# Altium project Main_Board.PrjPcb (part 43 of 44)
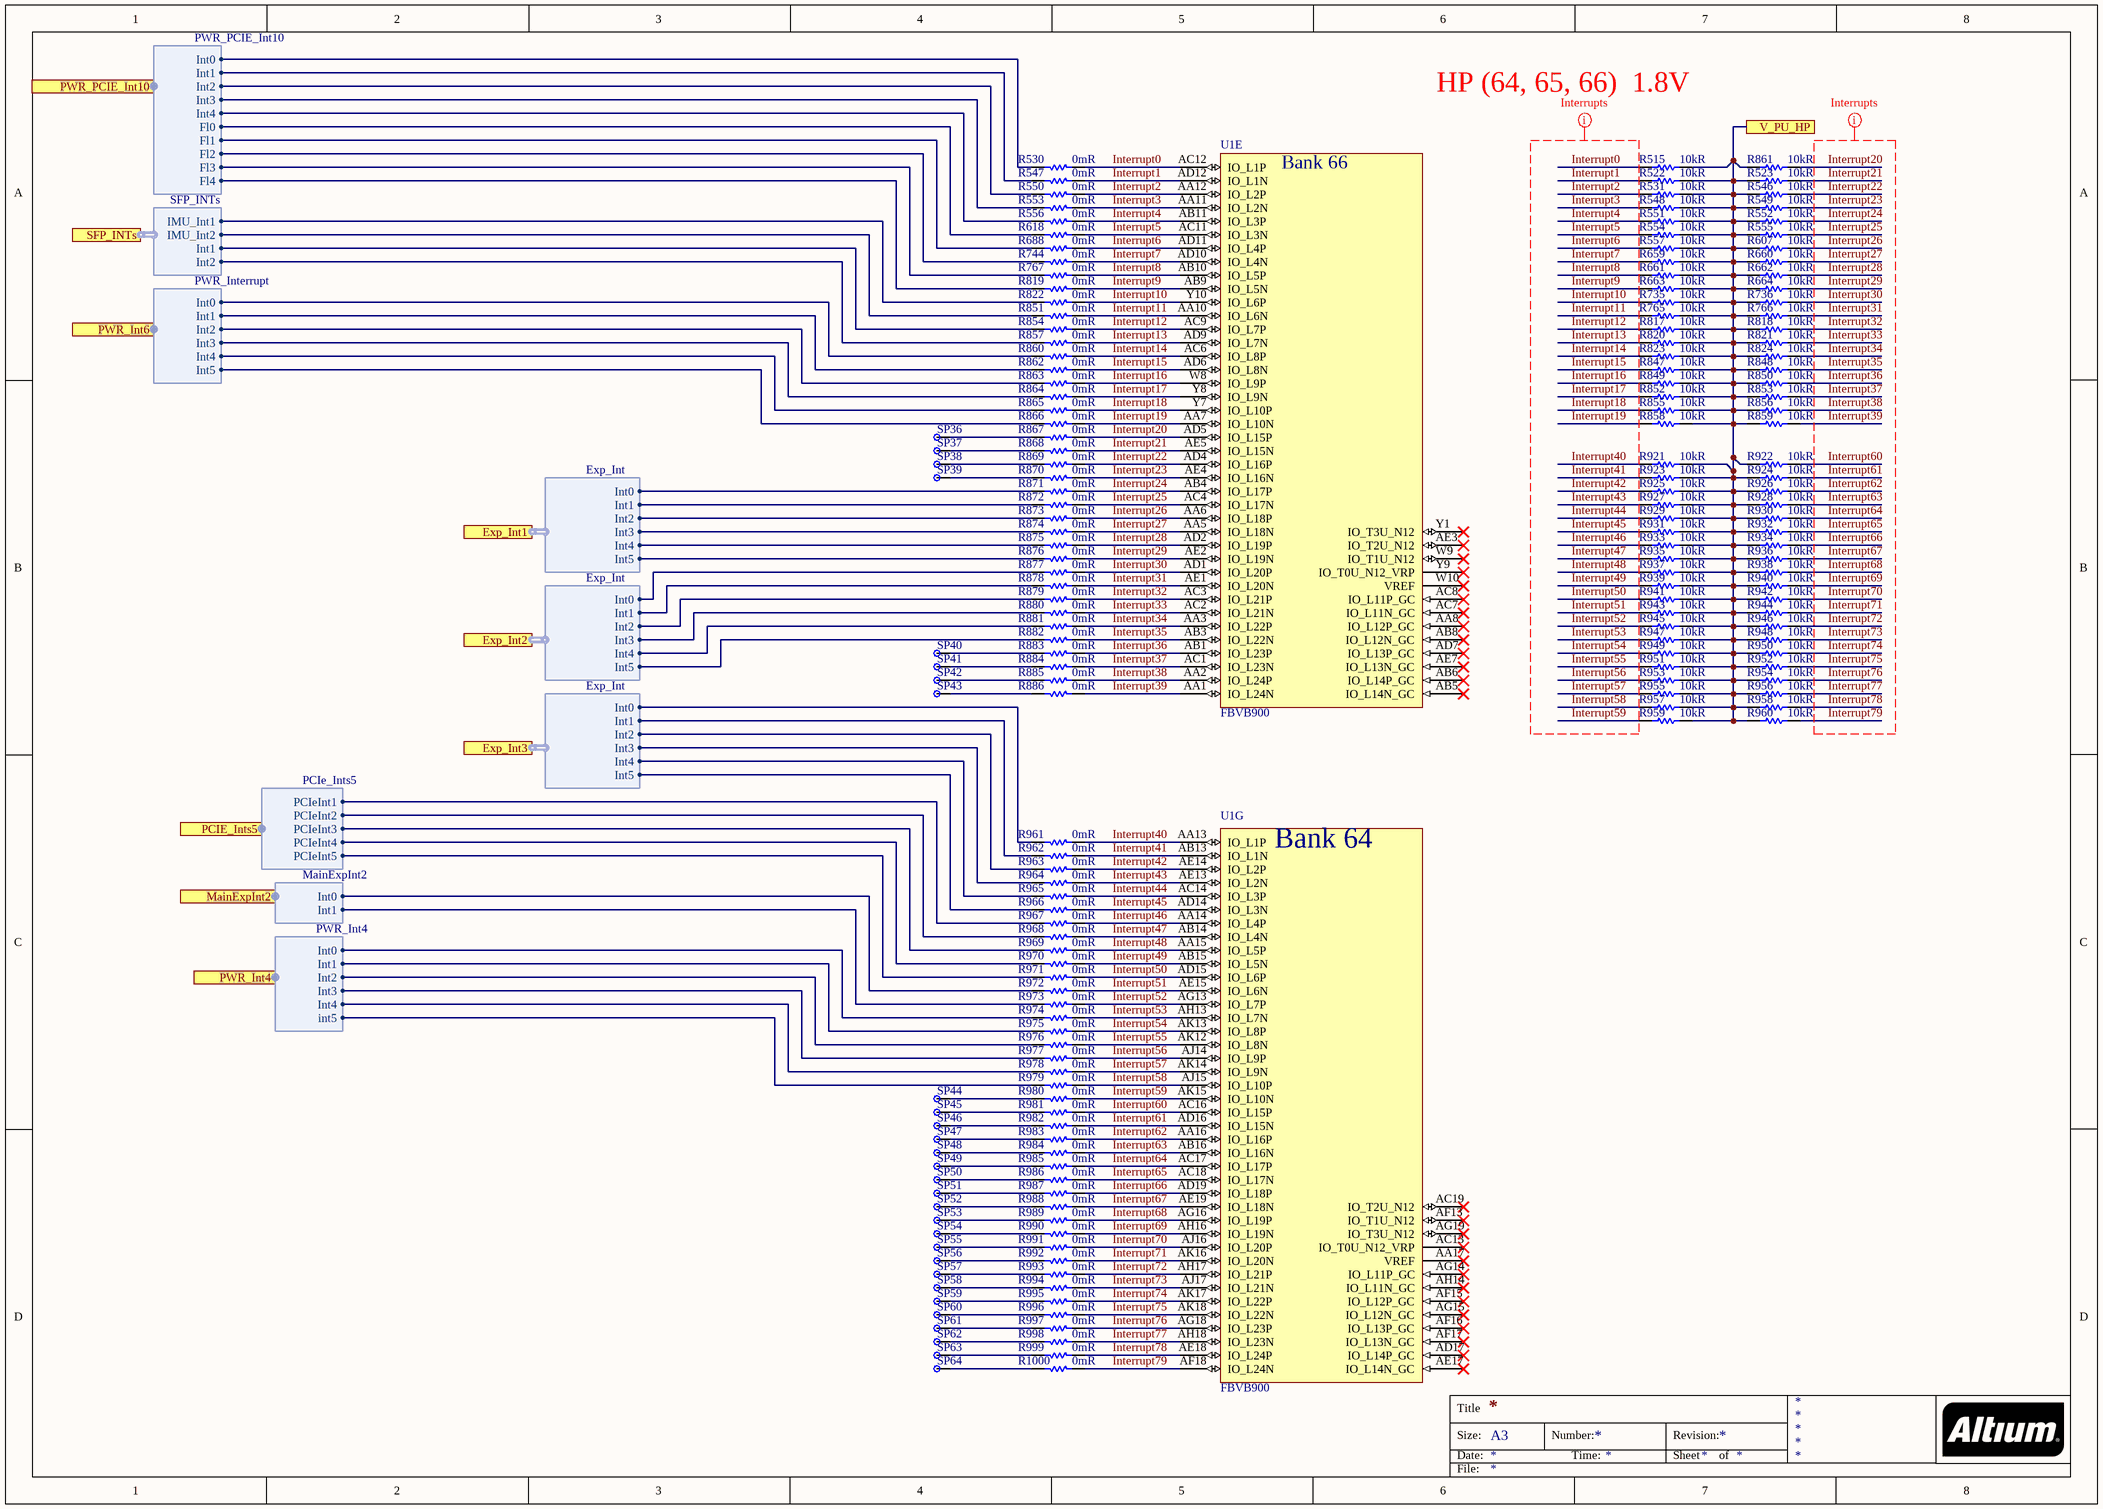
[diagram p70: US_Interrupts.SchDoc]
## Nets that join several sheets
B503_Ground: Ultrascale+_01 (13 pins), PS_Config (25 pins), LED_US_1 (9 pins), WR_Clock (5 pins), Ultrascale+_02 (U15.2 U15.10), JESD204_B_or_C (R450.2 R452.2 R454.2), HighSpeed/PCIE0 (23 pins), HighSpeed/PCIE1 (23 pins), HighSpeed/PCIE2 (23 pins), HighSpeed/PCIE3 (23 pins), HighSpeed/PCIE4 (23 pins), HighSpeed/I2C_Bridge_PCIE (C303_I2C_Bridge_PCIE.1 U3_I2C_Bridge_PCIE.9 U3_I2C_Bridge_PCIE.25), HighSpeed/SPI_bridge_PCIe (10 pins), Power4HiSpeed (50 pins), HighSpeed/Power4HighSpeed/U_Pomiar_pradu_napiecia_PCIe0 (C309_U_Pomiar_pradu_napiecia_PCIe0.1 U64_U_Pomiar_pradu_napiecia_PCIe0.7), HighSpeed/Power4HighSpeed/U_Pomiar_pradu_napiecia_PCIe1 (C309_U_Pomiar_pradu_napiecia_PCIe1.1 U64_U_Pomiar_pradu_napiecia_PCIe1.7), HighSpeed/Power4HighSpeed/U_Pomiar_pradu_napiecia_PCIe2 (C309_U_Pomiar_pradu_napiecia_PCIe2.1 U64_U_Pomiar_pradu_napiecia_PCIe2.7), HighSpeed/Power4HighSpeed/U_Pomiar_pradu_napiecia_PCIe3 (C309_U_Pomiar_pradu_napiecia_PCIe3.1 U64_U_Pomiar_pradu_napiecia_PCIe3.7), HighSpeed/Power4HighSpeed/U_Pomiar_pradu_napiecia_PCIe4 (C309_U_Pomiar_pradu_napiecia_PCIe4.1 U64_U_Pomiar_pradu_napiecia_PCIe4.7), Power_Distribution (13 pins), Power_Switch (85 pins), Power_Hi_Curr (21 pins), HI_Curr_ADP1850 (53 pins), Power_ADP1850_Dual (47 pins), Power_ADP1850_Dual_1 (47 pins), PowerDistribition/HiCurrent/U_Pomiar_pradu_napiecia_3 (C309_U_Pomiar_pradu_napiecia_3.1 U64_U_Pomiar_pradu_napiecia_3.7), PowerDistribition/HiCurrent/U_Pomiar_pradu_napiecia_4 (C309_U_Pomiar_pradu_napiecia_4.1 U64_U_Pomiar_pradu_napiecia_4.7), PowerDistribition/HiCurrent/U_Pomiar_pradu_napiecia_5 (C309_U_Pomiar_pradu_napiecia_5.1 U64_U_Pomiar_pradu_napiecia_5.7), PowerDistribition/HiCurrent/U_Pomiar_pradu_napiecia_6 (C309_U_Pomiar_pradu_napiecia_6.1 U64_U_Pomiar_pradu_napiecia_6.7), Pomiar_napiecia_high_curr (C310.1 U72.7), Power_Low_Curr (34 pins), Zasilanie_CLKDistribution (5 pins), PowerDistribition/Zasilanie CLK/I2C_Expander_PWR_CLK (C311_I2C_Expander_PWR_CLK.1 U35_I2C_Expander_PWR_CLK.6 U35_I2C_Expander_PWR_CLK.29), RAM_Power (136 pins), XilinxPower (10 pins), FPGA_Decoupling (28 pins), RAM (7 pins), Ground (286 pins), Power_Ethernet (20 pins), PowerDistribition/I2C_Expander_PWR_Dist (C311_I2C_Expander_PWR_Dist.1 U35_I2C_Expander_PWR_Dist.6 U35_I2C_Expander_PWR_Dist.29), PowerDistribition/U_Pomiar_pradu_napiecia_1 (C309_U_Pomiar_pradu_napiecia_1.1 U64_U_Pomiar_pradu_napiecia_1.7), PowerDistribition/U_Pomiar_pradu_napiecia_2 (C309_U_Pomiar_pradu_napiecia_2.1 U64_U_Pomiar_pradu_napiecia_2.7), Power_48_20V@3A (R764.1), TPS7A88_3V3_1V8_0V9V@2x1A (13 pins), ADP1741_3V3_0V85 (8 pins), ST1L08_5V_0V6 (7 pins), Power_LED (20 pins), Trans_LS_I2C0 (U36_Trans_LS_I2C0.1), GPIO_I2C (R242.2 R244.2 R400.2), Ext_GPIO/I2C_Bridge_GPIO (C303_I2C_Bridge_GPIO.1 U3_I2C_Bridge_GPIO.9 U3_I2C_Bridge_GPIO.25), Ext_GPIO_Bank0 (9 pins), Ext_GPIO/Ext_GPIO_Bank0/I2C_Expander_00 (C311_I2C_Expander_00.1 U35_I2C_Expander_00.6 U35_I2C_Expander_00.29), Ext_GPIO/Ext_GPIO_Bank0/I2C_Expander_01 (C311_I2C_Expander_01.1 U35_I2C_Expander_01.6 U35_I2C_Expander_01.29), Ext_GPIO/Ext_GPIO_Bank0/I2C_Expander_02 (C311_I2C_Expander_02.1 U35_I2C_Expander_02.6 U35_I2C_Expander_02.29), Ext_GPIO_Bank1 (9 pins), Ext_GPIO/Ext_GPIO_Bank1/I2C_Expander_10 (C311_I2C_Expander_10.1 U35_I2C_Expander_10.6 U35_I2C_Expander_10.29), Ext_GPIO/Ext_GPIO_Bank1/I2C_Expander_11 (C311_I2C_Expander_11.1 U35_I2C_Expander_11.6 U35_I2C_Expander_11.29), Ext_GPIO/Ext_GPIO_Bank1/I2C_Expander_12 (C311_I2C_Expander_12.1 U35_I2C_Expander_12.6 U35_I2C_Expander_12.29), SFP_Group (6 pins), SFP (12 pins), SFP1 (12 pins), SFP2 (12 pins), SFP3 (12 pins), SFP_Group+IMU/I2C_Bridge_SFP (C303_I2C_Bridge_SFP.1 U3_I2C_Bridge_SFP.9 U3_I2C_Bridge_SFP.25), IMU (7 pins), SFP_Group+IMU/I2C_Expander_SFP (C311_I2C_Expander_SFP.1 U35_I2C_Expander_SFP.6 U35_I2C_Expander_SFP.29), Trans_PS_I2C0 (U36_Trans_PS_I2C0.1), Trans_PS_I2C1 (U36_Trans_PS_I2C1.1), SPI_bridge_Main (10 pins), Trans_LS_I2C1 (U36_Trans_LS_I2C1.1), Detektor_otwarcia (12 pins), RJ45 (49 pins), Sata (16 pins), uSD (7 pins), FTDI (11 pins), USB3 (30 pins), CAN (C585.1 U63.2 U63.8 U75.3), eMMC (30 pins), Expander_RESET (5 pins), U_Expander_RESET/I2C_Expander_Main_Rst (C311_I2C_Expander_Main_Rst.1 U35_I2C_Expander_Main_Rst.6 U35_I2C_Expander_Main_Rst.29)
0.85V@40A_INA: HI_Curr_ADP1850 (26 pins), Pomiar_napiecia_high_curr (R617.1 U72.10)
0V9@1A_REG3: XilinxPower (6 pins), TPS7A88_3V3_1V8_0V9V@2x1A (5 pins)
0V85@2A: XilinxPower (U1.J23 U1.L23), FPGA_Decoupling (C746.2), ADP1741_3V3_0V85 (C675.2 FB45.2)
1V0@1.5A: Power_Ethernet (C555.2 R397.2 U51.8), RJ45 (14 pins)
1V8@0.5A_ADC_filtered: XilinxPower (14 pins), FPGA_Decoupling (C749.2 C750.2 C757.1 C758.2), TPS7A88_3V3_1V8_0V9V@2x1A (6 pins)
1V8@1.5A: Power_Ethernet (C553.2 R394.2 U50.8), IMU (C561.2 U58.8), RJ45 (8 pins), USB3 (C1.2 C2.2 U45.28 U45.30)
2V5@1.5A: RAM_Power (16 pins), Power_Ethernet (C551.2 R391.2 R392.2 U49.8), RJ45 (8 pins)
3.3V_LN_1: Zasilanie_CLKDistribution (12 pins), ADP1741_3.6V_3.3V@2A (C569.2 FB33.2)
3.3V_Stable_1: Zasilanie_CLKDistribution (38 pins), PowerDistribition/Zasilanie CLK/5to3V3_1 (6 pins)
3.3V_Stable_2: Zasilanie_CLKDistribution (38 pins), PowerDistribition/Zasilanie CLK/5to3V3_2 (6 pins)
3V3_NVMe: Power_Hi_Curr (8 pins), Sata (9 pins)
3V3_RAIL: LED_US_1 (9 pins), CLK_Mux (6 pins), Ultrascale+_02 (R124.2 U15.15), JESD204_B_or_C (R449.1 R451.1 R453.1), HighSpeed/PCIE0 (F1_PCIE0.2), HighSpeed/PCIE1 (F1_PCIE1.2), HighSpeed/PCIE2 (F1_PCIE2.2), HighSpeed/PCIE3 (F1_PCIE3.2), HighSpeed/PCIE4 (F1_PCIE4.2), HighSpeed/I2C_Bridge_PCIE (19 pins), HighSpeed/SPI_bridge_PCIe (30 pins), Power4HiSpeed (10 pins), HighSpeed/Power4HighSpeed/U_Pomiar_pradu_napiecia_PCIe0 (C309_U_Pomiar_pradu_napiecia_PCIe0.2 U64_U_Pomiar_pradu_napiecia_PCIe0.6), HighSpeed/Power4HighSpeed/U_Pomiar_pradu_napiecia_PCIe1 (C309_U_Pomiar_pradu_napiecia_PCIe1.2 U64_U_Pomiar_pradu_napiecia_PCIe1.6), HighSpeed/Power4HighSpeed/U_Pomiar_pradu_napiecia_PCIe2 (C309_U_Pomiar_pradu_napiecia_PCIe2.2 U64_U_Pomiar_pradu_napiecia_PCIe2.6), HighSpeed/Power4HighSpeed/U_Pomiar_pradu_napiecia_PCIe3 (C309_U_Pomiar_pradu_napiecia_PCIe3.2 U64_U_Pomiar_pradu_napiecia_PCIe3.6), HighSpeed/Power4HighSpeed/U_Pomiar_pradu_napiecia_PCIe4 (C309_U_Pomiar_pradu_napiecia_PCIe4.2 U64_U_Pomiar_pradu_napiecia_PCIe4.6), Power_Distribution (7 pins), Power_Switch (5 pins), Power_Hi_Curr (18 pins), Power_ADP1850_Dual (R287.2), PowerDistribition/HiCurrent/U_Pomiar_pradu_napiecia_3 (5 pins), PowerDistribition/HiCurrent/U_Pomiar_pradu_napiecia_4 (C309_U_Pomiar_pradu_napiecia_4.2 U64_U_Pomiar_pradu_napiecia_4.6), PowerDistribition/HiCurrent/U_Pomiar_pradu_napiecia_5 (C309_U_Pomiar_pradu_napiecia_5.2 U64_U_Pomiar_pradu_napiecia_5.6), PowerDistribition/HiCurrent/U_Pomiar_pradu_napiecia_6 (C309_U_Pomiar_pradu_napiecia_6.2 U64_U_Pomiar_pradu_napiecia_6.6), Pomiar_napiecia_high_curr (C310.2 U72.6), Power_Low_Curr (C623.2 U19.13 U19.16 U67.1), Zasilanie_CLKDistribution (R738.1 R740.1 R742.1), PowerDistribition/Zasilanie CLK/I2C_Expander_PWR_CLK (C311_I2C_Expander_PWR_CLK.2 U35_I2C_Expander_PWR_CLK.5), Power_Ethernet (14 pins), PowerDistribition/I2C_Expander_PWR_Dist (C311_I2C_Expander_PWR_Dist.2 U35_I2C_Expander_PWR_Dist.5), PowerDistribition/U_Pomiar_pradu_napiecia_1 (C309_U_Pomiar_pradu_napiecia_1.2 U64_U_Pomiar_pradu_napiecia_1.6), PowerDistribition/U_Pomiar_pradu_napiecia_2 (C309_U_Pomiar_pradu_napiecia_2.2 U64_U_Pomiar_pradu_napiecia_2.6), TPS7A88_3V3_1V8_0V9V@2x1A (7 pins), ADP1741_3V3_0V85 (7 pins), ST1L08_5V_0V6 (C721.2 R691.1 U73.2), Power_LED (18 pins), Trans_LS_I2C0 (R1122_Trans_LS_I2C0.1), GPIO_I2C (9 pins), Ext_GPIO/I2C_Bridge_GPIO (19 pins), Ext_GPIO_Bank0 (9 pins), Ext_GPIO/Ext_GPIO_Bank0/I2C_Expander_00 (C311_I2C_Expander_00.2 U35_I2C_Expander_00.5), Ext_GPIO/Ext_GPIO_Bank0/I2C_Expander_01 (C311_I2C_Expander_01.2 U35_I2C_Expander_01.5), Ext_GPIO/Ext_GPIO_Bank0/I2C_Expander_02 (C311_I2C_Expander_02.2 U35_I2C_Expander_02.5), Ext_GPIO_Bank1 (9 pins), Ext_GPIO/Ext_GPIO_Bank1/I2C_Expander_10 (C311_I2C_Expander_10.2 U35_I2C_Expander_10.5), Ext_GPIO/Ext_GPIO_Bank1/I2C_Expander_11 (C311_I2C_Expander_11.2 U35_I2C_Expander_11.5), Ext_GPIO/Ext_GPIO_Bank1/I2C_Expander_12 (C311_I2C_Expander_12.2 U35_I2C_Expander_12.5), SFP_Group (6 pins), SFP (8 pins), SFP1 (8 pins), SFP2 (8 pins), SFP3 (8 pins), SFP_Group+IMU/I2C_Bridge_SFP (19 pins), IMU (C562.2 R429.2 R600.2 U58.5), SFP_Group+IMU/I2C_Expander_SFP (C311_I2C_Expander_SFP.2 U35_I2C_Expander_SFP.5), Trans_PS_I2C0 (R1122_Trans_PS_I2C0.1 U36_Trans_PS_I2C0.2), Trans_PS_I2C1 (R1122_Trans_PS_I2C1.1), SPI_bridge_Main (30 pins), Trans_LS_I2C1 (R1122_Trans_LS_I2C1.1), uSD (C545.2 C546.2 J28.4 U47.A4), FTDI (8 pins), USB3 (7 pins), CAN (C585.2 U63.3), Expander_RESET (16 pins), U_Expander_RESET/I2C_Expander_Main_Rst (C311_I2C_Expander_Main_Rst.2 U35_I2C_Expander_Main_Rst.5)
5V_LN: DAC (R608.1 U30.1 U30.5 X2.14), Zasilanie_CLKDistribution (U12.42), LT3042_12V_5V_LNLDO (5 pins)
5V_RAIL: Power_ADP1850_Dual_1 (R315.2), PowerDistribition/HiCurrent/U_Pomiar_pradu_napiecia_6 (R448_U_Pomiar_pradu_napiecia_6.2 U64_U_Pomiar_pradu_napiecia_6.8 U64_U_Pomiar_pradu_napiecia_6.9), PowerDistribition/Zasilanie CLK/5to3V3_1 (C563_5to3V3_1.2 C564_5to3V3_1.2 U59_5to3V3_1.1 U59_5to3V3_1.2), PowerDistribition/Zasilanie CLK/5to3V3_2 (C563_5to3V3_2.2 C564_5to3V3_2.2 U59_5to3V3_2.1 U59_5to3V3_2.2), TPS7A88_5V_Dual_3.3V_3.3V (6 pins), ST1L08_5V_0V6 (C720.2 U73.1), Detektor_otwarcia (6 pins), USB3 (10 pins), eMMC (8 pins)
12V_LT3042: Power4HiSpeed (35 pins), Power_ADP1850_Dual_1 (R626.2), PowerDistribition/HiCurrent/U_Pomiar_pradu_napiecia_5 (R448_U_Pomiar_pradu_napiecia_5.2 U64_U_Pomiar_pradu_napiecia_5.8 U64_U_Pomiar_pradu_napiecia_5.9), Power_Low_Curr (10 pins), LT3042_12V_5V_LNLDO (FB34.1), UM78M_12_8V (C714.2 U71.1)
12V_PCIE0: Power4HiSpeed (7 pins), HighSpeed/Power4HighSpeed/U_Pomiar_pradu_napiecia_PCIe0 (R448_U_Pomiar_pradu_napiecia_PCIe0.1 U64_U_Pomiar_pradu_napiecia_PCIe0.10)
12V_PCIE0_CM: HighSpeed/PCIE0 (J1_PCIE0.2 J1_PCIE0.4), HighSpeed/Power4HighSpeed/U_Pomiar_pradu_napiecia_PCIe0 (R448_U_Pomiar_pradu_napiecia_PCIe0.2 U64_U_Pomiar_pradu_napiecia_PCIe0.8 U64_U_Pomiar_pradu_napiecia_PCIe0.9)
12V_PCIE1: Power4HiSpeed (7 pins), HighSpeed/Power4HighSpeed/U_Pomiar_pradu_napiecia_PCIe1 (R448_U_Pomiar_pradu_napiecia_PCIe1.1 U64_U_Pomiar_pradu_napiecia_PCIe1.10)
12V_PCIE1_CM: HighSpeed/PCIE1 (J1_PCIE1.2 J1_PCIE1.4), HighSpeed/Power4HighSpeed/U_Pomiar_pradu_napiecia_PCIe1 (R448_U_Pomiar_pradu_napiecia_PCIe1.2 U64_U_Pomiar_pradu_napiecia_PCIe1.8 U64_U_Pomiar_pradu_napiecia_PCIe1.9)
12V_PCIE2: Power4HiSpeed (7 pins), HighSpeed/Power4HighSpeed/U_Pomiar_pradu_napiecia_PCIe2 (R448_U_Pomiar_pradu_napiecia_PCIe2.1 U64_U_Pomiar_pradu_napiecia_PCIe2.10)
12V_PCIE2_CM: HighSpeed/PCIE2 (J1_PCIE2.2 J1_PCIE2.4), HighSpeed/Power4HighSpeed/U_Pomiar_pradu_napiecia_PCIe2 (R448_U_Pomiar_pradu_napiecia_PCIe2.2 U64_U_Pomiar_pradu_napiecia_PCIe2.8 U64_U_Pomiar_pradu_napiecia_PCIe2.9)
12V_PCIE3: Power4HiSpeed (7 pins), HighSpeed/Power4HighSpeed/U_Pomiar_pradu_napiecia_PCIe3 (R448_U_Pomiar_pradu_napiecia_PCIe3.1 U64_U_Pomiar_pradu_napiecia_PCIe3.10)
12V_PCIE3_CM: HighSpeed/PCIE3 (J1_PCIE3.2 J1_PCIE3.4), HighSpeed/Power4HighSpeed/U_Pomiar_pradu_napiecia_PCIe3 (R448_U_Pomiar_pradu_napiecia_PCIe3.2 U64_U_Pomiar_pradu_napiecia_PCIe3.8 U64_U_Pomiar_pradu_napiecia_PCIe3.9)
12V_PCIE4: Power4HiSpeed (7 pins), HighSpeed/Power4HighSpeed/U_Pomiar_pradu_napiecia_PCIe4 (R448_U_Pomiar_pradu_napiecia_PCIe4.1 U64_U_Pomiar_pradu_napiecia_PCIe4.10)
12V_PCIE4_CM: HighSpeed/PCIE4 (J1_PCIE4.2 J1_PCIE4.4), HighSpeed/Power4HighSpeed/U_Pomiar_pradu_napiecia_PCIe4 (R448_U_Pomiar_pradu_napiecia_PCIe4.2 U64_U_Pomiar_pradu_napiecia_PCIe4.8 U64_U_Pomiar_pradu_napiecia_PCIe4.9)
ADP1741_3.6V: Power_Low_Curr (6 pins), ADP1741_3.6V_3.3V@2A (7 pins)
ADP1741_EN: ADP1741_3.6V_3.3V@2A (U60.4), PowerDistribition/Zasilanie CLK/I2C_Expander_PWR_CLK (U35_I2C_Expander_PWR_CLK.20)
ADP1741_PG: ADP1741_3.6V_3.3V@2A (R846#1.2 U60.5), PowerDistribition/Zasilanie CLK/I2C_Expander_PWR_CLK (U35_I2C_Expander_PWR_CLK.19), Power_LED (T43.1)
AGND: System_CLK (16 pins), DAC (18 pins), CLK_Mux (47 pins), LTC6952_1 (8 pins), LTC6952 (6 pins), Zasilanie_CLKDistribution (75 pins), ADP1741_3.6V_3.3V@2A (7 pins), PowerDistribition/Zasilanie CLK/5to3V3_1 (8 pins), PowerDistribition/Zasilanie CLK/5to3V3_2 (8 pins), LT3042_12V_5V_LNLDO (10 pins), UM78M_12_8V (C713.1 C714.1 U71.2)
B223_Rx0_N: HighSpeed/PCIE0 (J1_PCIE0.21), Bank223 (U1.W3)
B223_Rx0_P: HighSpeed/PCIE0 (J1_PCIE0.19), Bank223 (U1.W4)
B223_Rx1_N: HighSpeed/PCIE0 (J1_PCIE0.27), Bank223 (U1.V5)
B223_Rx1_P: HighSpeed/PCIE0 (J1_PCIE0.25), Bank223 (U1.V6)
B223_Rx2_N: HighSpeed/PCIE1 (J1_PCIE1.21), Bank223 (U1.T5)
B223_Rx2_P: HighSpeed/PCIE1 (J1_PCIE1.19), Bank223 (U1.T6)
B223_Rx3_N: HighSpeed/PCIE1 (J1_PCIE1.27), Bank223 (U1.R3)
B223_Rx3_P: HighSpeed/PCIE1 (J1_PCIE1.25), Bank223 (U1.R4)
B223_Tx0_to_C_N: HighSpeed/PCIE0 (J1_PCIE0.26), Bank223 (C268.1)
B223_Tx0_to_C_P: HighSpeed/PCIE0 (J1_PCIE0.24), Bank223 (C267.1)
B223_Tx1_to_C_N: HighSpeed/PCIE0 (J1_PCIE0.32), Bank223 (C270.1)
B223_Tx1_to_C_P: HighSpeed/PCIE0 (J1_PCIE0.30), Bank223 (C269.1)
B223_Tx2_to_C_N: HighSpeed/PCIE1 (J1_PCIE1.26), Bank223 (C272.1)
B223_Tx2_to_C_P: HighSpeed/PCIE1 (J1_PCIE1.24), Bank223 (C271.1)
B223_Tx3_to_C_N: HighSpeed/PCIE1 (J1_PCIE1.32), Bank223 (C275.1)
B223_Tx3_to_C_P: HighSpeed/PCIE1 (J1_PCIE1.30), Bank223 (C274.1)
B224_Rx0_N: HighSpeed/PCIE2 (J1_PCIE2.21), Bank224 (U1.P5)
B224_Rx0_P: HighSpeed/PCIE2 (J1_PCIE2.19), Bank224 (U1.P6)
B224_Rx1_N: HighSpeed/PCIE2 (J1_PCIE2.27), Bank224 (U1.M5)
B224_Rx1_P: HighSpeed/PCIE2 (J1_PCIE2.25), Bank224 (U1.M6)
B224_Rx2_N: HighSpeed/PCIE3 (J1_PCIE3.21), Bank224 (U1.L3)
B224_Rx2_P: HighSpeed/PCIE3 (J1_PCIE3.19), Bank224 (U1.L4)
B224_Rx3_N: HighSpeed/PCIE3 (J1_PCIE3.27), Bank224 (U1.K5)
B224_Rx3_P: HighSpeed/PCIE3 (J1_PCIE3.25), Bank224 (U1.K6)
B224_Tx0_to_C_N: HighSpeed/PCIE2 (J1_PCIE2.26), Bank224 (C280.1)
B224_Tx0_to_C_P: HighSpeed/PCIE2 (J1_PCIE2.24), Bank224 (C279.1)
B224_Tx1_to_C_N: HighSpeed/PCIE2 (J1_PCIE2.32), Bank224 (C282.1)
B224_Tx1_to_C_P: HighSpeed/PCIE2 (J1_PCIE2.30), Bank224 (C281.1)
B224_Tx2_to_C_N: HighSpeed/PCIE3 (J1_PCIE3.26), Bank224 (C284.1)
B224_Tx2_to_C_P: HighSpeed/PCIE3 (J1_PCIE3.24), Bank224 (C283.1)
B224_Tx3_to_C_N: HighSpeed/PCIE3 (J1_PCIE3.32), Bank224 (C287.1)
B224_Tx3_to_C_P: HighSpeed/PCIE3 (J1_PCIE3.30), Bank224 (C286.1)
B225_Rx0_N: HighSpeed/PCIE4 (J1_PCIE4.21), Bank225 (U1.H5)
B225_Rx0_P: HighSpeed/PCIE4 (J1_PCIE4.19), Bank225 (U1.H6)
B225_Rx1_N: HighSpeed/PCIE4 (J1_PCIE4.27), Bank225 (U1.G7)
B225_Rx1_P: HighSpeed/PCIE4 (J1_PCIE4.25), Bank225 (U1.G8)
B225_Tx0_to_C_N: HighSpeed/PCIE4 (J1_PCIE4.26), Bank225 (C292.1)
B225_Tx0_to_C_P: HighSpeed/PCIE4 (J1_PCIE4.24), Bank225 (C291.1)
B225_Tx1_to_C_N: HighSpeed/PCIE4 (J1_PCIE4.32), Bank225 (C294.1)
B225_Tx1_to_C_P: HighSpeed/PCIE4 (J1_PCIE4.30), Bank225 (C293.1)
B225_Tx2_to_C_N: HighSpeed/PCIE4 (J1_PCIE4.38), Bank225 (C296.1)
B225_Tx2_to_C_P: HighSpeed/PCIE4 (J1_PCIE4.36), Bank225 (C295.1)
B225_Tx3_to_C_N: HighSpeed/PCIE4 (J1_PCIE4.44), Bank225 (C299.1)
B225_Tx3_to_C_P: HighSpeed/PCIE4 (J1_PCIE4.42), Bank225 (C298.1)
Bank223_MGTREF0_N: HighSpeed/PCIE0 (J1_PCIE0.39), Bank223 (C50.1 C276.2)
Bank223_MGTREF0_P: HighSpeed/PCIE0 (J1_PCIE0.37), Bank223 (C50.2 C273.2)
Bank223_MGTREF1_N: HighSpeed/PCIE1 (J1_PCIE1.37), Bank223 (C278.2 C557.1)
Bank223_MGTREF1_P: HighSpeed/PCIE1 (J1_PCIE1.39), Bank223 (C277.2 C557.2)
Bank224_MGTREF0_N: HighSpeed/PCIE2 (J1_PCIE2.39), Bank224 (C288.2 C687.2)
Bank224_MGTREF0_P: HighSpeed/PCIE2 (J1_PCIE2.37), Bank224 (C285.2 C687.1)
Bank224_MGTREF1_N: HighSpeed/PCIE3 (J1_PCIE3.39), Bank224 (C290.2 C689.2)
Bank224_MGTREF1_P: HighSpeed/PCIE3 (J1_PCIE3.37), Bank224 (C289.2 C689.1)
Bank225_MGTREF0_N: HighSpeed/PCIE4 (J1_PCIE4.39), Bank225 (C300.2 C820.2)
Bank225_MGTREF0_P: HighSpeed/PCIE4 (J1_PCIE4.37), Bank225 (C297.2 C820.1)
Battery_PWR: Power_Distribution (P11.1), Power_Switch (R679.2 R680.2 U48.2)
CAN1_RxD: Ultrascale+_01 (R798.1), CAN (U63.1)
CAN1_TxD: Ultrascale+_01 (R799.1), CAN (U63.4)
Charge_CAP: Ext_GPIO/Ext_GPIO_Bank1/I2C_Expander_11 (U35_I2C_Expander_11.4), Detektor_otwarcia (R658.2)
CLK0_EZS_N: LTC6952 (R81.1 U12.48), Ultrascale+_02 (U1.D16)
CLK0_EZS_P: LTC6952 (R81.2 U12.47), Ultrascale+_02 (U1.C16)
CLK0_SPI.~{CS}: LTC6952 (U12.1), SPI_bridge_Main (R236_SPI_bridge_Main.1 SP25_SPI_bridge_Main.1 U26_SPI_bridge_Main.11)
CLK0_SPI.CLK: LTC6952 (U12.50), SPI_bridge_Main (U26_SPI_bridge_Main.14)
CLK0_SPI.MISO: LTC6952 (U12.51), SPI_bridge_Main (U26_SPI_bridge_Main.13)
CLK0_SPI.MOSI: LTC6952 (U12.52), SPI_bridge_Main (U26_SPI_bridge_Main.12)
CLK1_SPI.~{CS}: LTC6952_1 (U13.1), SPI_bridge_Main (R233_SPI_bridge_Main.1 SP23_SPI_bridge_Main.1 U25_SPI_bridge_Main.11)
CLK1_SPI.CLK: LTC6952_1 (U13.50), SPI_bridge_Main (U25_SPI_bridge_Main.14)
CLK1_SPI.MISO: LTC6952_1 (U13.51), SPI_bridge_Main (U25_SPI_bridge_Main.13)
CLK1_SPI.MOSI: LTC6952_1 (U13.52), SPI_bridge_Main (U25_SPI_bridge_Main.12)
CSN: Power_Switch (R17.2 U4.2), Power_48_20V@3A (11 pins)
CSU: Ultrascale+_01 (P1.2 R783.1 TP34.1), Detektor_otwarcia (R649.1)
D_05028_G0: WR_Clock (R540.1 U16.45), Ultrascale+_02 (R904.2)
D_05028_G3: WR_Clock (U16.40), Ext_GPIO/Ext_GPIO_Bank1/I2C_Expander_12 (U35_I2C_Expander_12.25)
D_05028_G4: WR_Clock (U16.41), Ext_GPIO/Ext_GPIO_Bank0/I2C_Expander_00 (U35_I2C_Expander_00.28)
D_05028_G5: WR_Clock (U16.12), Ext_GPIO/Ext_GPIO_Bank1/I2C_Expander_12 (U35_I2C_Expander_12.22)
D_05028_G6: WR_Clock (U16.13), Ext_GPIO/Ext_GPIO_Bank1/I2C_Expander_12 (U35_I2C_Expander_12.21)
D_05028_S0: WR_Clock (U16.55), Ext_GPIO/Ext_GPIO_Bank1/I2C_Expander_12 (U35_I2C_Expander_12.24)
D_05028_S1: WR_Clock (U16.56), Ext_GPIO/Ext_GPIO_Bank1/I2C_Expander_12 (U35_I2C_Expander_12.23)
DAC_SPI_CLK: DAC (U30.16), SPI_bridge_Main (U27_SPI_bridge_Main.14)
DAC_SPI_MOSI: DAC (R481.1 U30.15), SPI_bridge_Main (U27_SPI_bridge_Main.12)
eMMC_clk: Ultrascale+_01 (R112.2), eMMC (U41.M6)
eMMC_cmd: Ultrascale+_01 (R111.2), eMMC (U41.M5)
eMMC_data0: Ultrascale+_01 (R105.2), eMMC (U41.A3)
eMMC_data1: Ultrascale+_01 (R107.2), eMMC (U41.A4)
eMMC_data2: Ultrascale+_01 (R108.2), eMMC (U41.A5)
eMMC_data3: Ultrascale+_01 (R110.2), eMMC (U41.B2)
eMMC_data4: Ultrascale+_01 (R101.2), eMMC (U41.B3)
eMMC_data5: Ultrascale+_01 (R102.2), eMMC (U41.B4)
eMMC_data6: Ultrascale+_01 (R103.2), eMMC (U41.B5)
eMMC_data7: Ultrascale+_01 (R104.2), eMMC (U41.B6)
eMMC_PG1: Ext_GPIO/Ext_GPIO_Bank0/I2C_Expander_01 (U35_I2C_Expander_01.4), eMMC (R340.1 U40.5)
eMMC_PG2: Ext_GPIO/Ext_GPIO_Bank0/I2C_Expander_01 (U35_I2C_Expander_01.3), eMMC (R343.1 R345.1 U42.5)
eMMC_rst: Ultrascale+_01 (R99.1 R797.1 SP19.1), eMMC (U41.K5)
EN1: TPS7A88_5V_Dual_3.3V_3.3V (U61.20), PowerDistribition/Zasilanie CLK/I2C_Expander_PWR_CLK (U35_I2C_Expander_PWR_CLK.26)
EN1_TPS: HI_Curr_ADP1850 (R277.2 R278.2 U34.14 U34.27), TPS7A88_3V3_1V8_0V9V@2x1A (U70.20), Power_LED (R916.1)
EN2: TPS7A88_5V_Dual_3.3V_3.3V (U61.6), PowerDistribition/Zasilanie CLK/I2C_Expander_PWR_CLK (U35_I2C_Expander_PWR_CLK.27)
EN2_TPS: TPS7A88_3V3_1V8_0V9V@2x1A (R745.2 U70.6 U70.17), Power_LED (T4.1)
EN_0.85V_REG1: Power_Hi_Curr (S5.8), HI_Curr_ADP1850 (U34.1 U34.8)
En_0V85@2A: Power_ADP1850_Dual (R296.2 U37.14), ADP1741_3V3_0V85 (R435.2)
EN_3V3V_REG0: Power_Hi_Curr (S5.6), Power_ADP1850_Dual (U37.1)
EN_5V_REG0: Power_Hi_Curr (S5.7), Power_ADP1850_Dual_1 (U38.8)
EN_12@8A: Power_Hi_Curr (S5.5), Power_ADP1850_Dual_1 (U38.1)
EN_Detect: Ext_GPIO/Ext_GPIO_Bank1/I2C_Expander_12 (U35_I2C_Expander_12.3), Detektor_otwarcia (R655.1)
EN_PS_LTC6952_1: PowerDistribition/Zasilanie CLK/5to3V3_1 (U59_5to3V3_1.3), PowerDistribition/Zasilanie CLK/I2C_Expander_PWR_CLK (U35_I2C_Expander_PWR_CLK.18)
EN_PS_LTC6952_2: PowerDistribition/Zasilanie CLK/5to3V3_2 (U59_5to3V3_2.3), PowerDistribition/Zasilanie CLK/I2C_Expander_PWR_CLK (U35_I2C_Expander_PWR_CLK.22)
EN_PWR_PCIE_3: Power4HiSpeed (U22.A2), Ext_GPIO/Ext_GPIO_Bank0/I2C_Expander_02 (U35_I2C_Expander_02.24)
EN_PWR_PCIE_4: Power4HiSpeed (U23.A2), Ext_GPIO/Ext_GPIO_Bank0/I2C_Expander_00 (U35_I2C_Expander_00.19)
En_PWRSwitch_PCIE0: Power4HiSpeed (U17.A2), Ext_GPIO/Ext_GPIO_Bank1/I2C_Expander_10 (U35_I2C_Expander_10.27)
En_PWRSwitch_PCIE1: Power4HiSpeed (U20.A2), Ext_GPIO/Ext_GPIO_Bank1/I2C_Expander_11 (U35_I2C_Expander_11.19)
En_PWRSwitch_PCIE2: Power4HiSpeed (U21.A2), Ext_GPIO/Ext_GPIO_Bank1/I2C_Expander_10 (U35_I2C_Expander_10.17)
EN_SEQ_LT3504: Power_Low_Curr (U67.3), ADP1741_3V3_0V85 (R646.2 U69.5), Power_LED (T48.1)
EN_SPI_Q0_MAIN: Ext_GPIO/Ext_GPIO_Bank1/I2C_Expander_11 (U35_I2C_Expander_11.20), SPI_bridge_Main (R232_SPI_bridge_Main.1)
EN_SPI_Q1: HighSpeed/SPI_bridge_PCIe (R234_SPI_bridge_PCIe.1), Ext_GPIO/Ext_GPIO_Bank1/I2C_Expander_11 (U35_I2C_Expander_11.17)
EN_SPI_Q1_MAIN: Ext_GPIO/Ext_GPIO_Bank1/I2C_Expander_11 (U35_I2C_Expander_11.22), SPI_bridge_Main (R234_SPI_bridge_Main.1)
EN_SPI_Q2: HighSpeed/SPI_bridge_PCIe (R235_SPI_bridge_PCIe.2), Ext_GPIO/Ext_GPIO_Bank1/I2C_Expander_10 (U35_I2C_Expander_10.4)
EN_SPI_Q4: HighSpeed/SPI_bridge_PCIe (R239_SPI_bridge_PCIe.1), Ext_GPIO/Ext_GPIO_Bank1/I2C_Expander_11 (U35_I2C_Expander_11.25)
EN_SPI_Q4_MAIN: Ext_GPIO/Ext_GPIO_Bank1/I2C_Expander_11 (U35_I2C_Expander_11.28), SPI_bridge_Main (R239_SPI_bridge_Main.1)
Enable_CLK: LTC6952_1 (U13.40), LTC6952 (U12.40), U_Expander_RESET/I2C_Expander_Main_Rst (U35_I2C_Expander_Main_Rst.2)
ETH_VDDIO: Ultrascale+_01 (10 pins), PS_Config (32 pins), Power_Low_Curr (6 pins), XilinxPower (11 pins), FPGA_Decoupling (C742.1 C743.2), Power_Ethernet (U68.3), Trans_PS_I2C1 (U36_Trans_PS_I2C1.2), RJ45 (24 pins), uSD (5 pins), FTDI (U53.15 U56.15 U57.15)
EXPANDER_RESET: Ultrascale+_01 (J21.2 P13.2 R811.1), LED_US_1 (R1115.2), Expander_RESET (R1003.2 T1.1)
Flag_PWRSwitch_PCIE0: Power4HiSpeed (U17.A3), US_Interrupts (R618.2)
Flag_PWRSwitch_PCIE1: Power4HiSpeed (U20.A3), US_Interrupts (R688.2)
Flag_PWRSwitch_PCIE2: Power4HiSpeed (U21.A3), US_Interrupts (R744.2)
Flag_PWRSwitch_PCIE3: Power4HiSpeed (U22.A3), US_Interrupts (R767.2)
Flag_PWRSwitch_PCIE4: Power4HiSpeed (U23.A3), US_Interrupts (R819.2)
FTDI_5V: FTDI (C559.1 C560.2 FB31.1), U_Peripherals/Debug/5V_to_3V3_for_FTDI (5 pins)
FTDI_GND: FTDI (58 pins), U_Peripherals/Debug/5V_to_3V3_for_FTDI (8 pins)
FTDI_JTAG_ON_1: Ext_GPIO/Ext_GPIO_Bank1/I2C_Expander_12 (U35_I2C_Expander_12.17), FTDI (5 pins)
FTDI_JTAG_ON_2: Ext_GPIO/Ext_GPIO_Bank1/I2C_Expander_12 (U35_I2C_Expander_12.18), FTDI (R410.1 S8.2 S9.2 U56.9)
FTDI_JTAG_ON_3: Ext_GPIO/Ext_GPIO_Bank1/I2C_Expander_12 (U35_I2C_Expander_12.19), FTDI (R635.1 S8.3 S9.3 U57.9)
FTDI_JTAG_ON_4: Ext_GPIO/Ext_GPIO_Bank1/I2C_Expander_12 (U35_I2C_Expander_12.20), FTDI (R721.1 S8.4 S9.4 U79.9)
FTDI_VccIO: FTDI (47 pins), U_Peripherals/Debug/5V_to_3V3_for_FTDI (6 pins)
GEM3_MDC: Ultrascale+_01 (R815.1), RJ45 (U39.16)
GEM3_MDIO: Ultrascale+_01 (R816.1), RJ45 (R333.2 U39.17)
GPIO_ETH_EXPANDER: Ext_GPIO/Ext_GPIO_Bank1/I2C_Expander_10 (U35_I2C_Expander_10.2), RJ45 (R715.1 U76.2)
GPIO_Exp10_Adress0: Ext_GPIO_Bank0 (R492.2 R493.1), Ext_GPIO/Ext_GPIO_Bank0/I2C_Expander_00 (U35_I2C_Expander_00.13)
GPIO_Exp10_Adress1: Ext_GPIO_Bank0 (R494.2 R495.1), Ext_GPIO/Ext_GPIO_Bank0/I2C_Expander_00 (U35_I2C_Expander_00.12)
GPIO_Exp10_Adress2: Ext_GPIO_Bank0 (R496.2 R497.1), Ext_GPIO/Ext_GPIO_Bank0/I2C_Expander_00 (U35_I2C_Expander_00.11)
GPIO_Exp10_Int0: Ext_GPIO/Ext_GPIO_Bank0/I2C_Expander_00 (U35_I2C_Expander_00.16), US_Interrupts (R871.2)
GPIO_Exp10_Int1: Ext_GPIO/Ext_GPIO_Bank0/I2C_Expander_00 (U35_I2C_Expander_00.15), US_Interrupts (R872.2)
GPIO_Exp11_Adress0: Ext_GPIO_Bank0 (R500.2 R501.1), Ext_GPIO/Ext_GPIO_Bank0/I2C_Expander_01 (U35_I2C_Expander_01.13)
GPIO_Exp11_Adress1: Ext_GPIO_Bank0 (R502.2 R503.1), Ext_GPIO/Ext_GPIO_Bank0/I2C_Expander_01 (U35_I2C_Expander_01.12)
GPIO_Exp11_Adress2: Ext_GPIO_Bank0 (R504.2 R505.1), Ext_GPIO/Ext_GPIO_Bank0/I2C_Expander_01 (U35_I2C_Expander_01.11)
GPIO_Exp11_Int0: Ext_GPIO/Ext_GPIO_Bank0/I2C_Expander_01 (U35_I2C_Expander_01.16), US_Interrupts (R873.2)
GPIO_Exp11_Int1: Ext_GPIO/Ext_GPIO_Bank0/I2C_Expander_01 (U35_I2C_Expander_01.15), US_Interrupts (R874.2)
GPIO_Exp12_Adress0: Ext_GPIO_Bank0 (R508.2 R509.1), Ext_GPIO/Ext_GPIO_Bank0/I2C_Expander_02 (U35_I2C_Expander_02.13)
GPIO_Exp12_Adress1: Ext_GPIO_Bank0 (R510.2 R511.1), Ext_GPIO/Ext_GPIO_Bank0/I2C_Expander_02 (U35_I2C_Expander_02.12)
GPIO_Exp12_Adress2: Ext_GPIO_Bank0 (R512.2 R513.1), Ext_GPIO/Ext_GPIO_Bank0/I2C_Expander_02 (U35_I2C_Expander_02.11)
GPIO_Exp12_Int0: Ext_GPIO/Ext_GPIO_Bank0/I2C_Expander_02 (U35_I2C_Expander_02.16), US_Interrupts (R875.2)
GPIO_Exp12_Int1: Ext_GPIO/Ext_GPIO_Bank0/I2C_Expander_02 (U35_I2C_Expander_02.15), US_Interrupts (R876.2)
GPIO_Exp13_Adress0: Ext_GPIO_Bank1 (R516.2 R517.1), Ext_GPIO/Ext_GPIO_Bank1/I2C_Expander_10 (U35_I2C_Expander_10.13)
GPIO_Exp13_Adress1: Ext_GPIO_Bank1 (R518.2 R519.1), Ext_GPIO/Ext_GPIO_Bank1/I2C_Expander_10 (U35_I2C_Expander_10.12)
GPIO_Exp13_Adress2: Ext_GPIO_Bank1 (R520.2 R521.1), Ext_GPIO/Ext_GPIO_Bank1/I2C_Expander_10 (U35_I2C_Expander_10.11)
GPIO_Exp13_Int0: Ext_GPIO/Ext_GPIO_Bank1/I2C_Expander_10 (U35_I2C_Expander_10.16), US_Interrupts (R877.2)
GPIO_Exp13_Int1: Ext_GPIO/Ext_GPIO_Bank1/I2C_Expander_10 (U35_I2C_Expander_10.15), US_Interrupts (R878.2)
GPIO_Exp14_Adress0: Ext_GPIO_Bank1 (R524.2 R525.1), Ext_GPIO/Ext_GPIO_Bank1/I2C_Expander_11 (U35_I2C_Expander_11.13)
GPIO_Exp14_Adress1: Ext_GPIO_Bank1 (R526.2 R527.1), Ext_GPIO/Ext_GPIO_Bank1/I2C_Expander_11 (U35_I2C_Expander_11.12)
GPIO_Exp14_Adress2: Ext_GPIO_Bank1 (R528.2 R529.1), Ext_GPIO/Ext_GPIO_Bank1/I2C_Expander_11 (U35_I2C_Expander_11.11)
GPIO_Exp14_Int0: Ext_GPIO/Ext_GPIO_Bank1/I2C_Expander_11 (U35_I2C_Expander_11.16), US_Interrupts (R879.2)
GPIO_Exp14_Int1: Ext_GPIO/Ext_GPIO_Bank1/I2C_Expander_11 (U35_I2C_Expander_11.15), US_Interrupts (R880.2)
GPIO_Exp15_Adress0: Ext_GPIO_Bank1 (R697.2 R698.1), Ext_GPIO/Ext_GPIO_Bank1/I2C_Expander_12 (U35_I2C_Expander_12.13)
GPIO_Exp15_Adress1: Ext_GPIO_Bank1 (R699.2 R700.1), Ext_GPIO/Ext_GPIO_Bank1/I2C_Expander_12 (U35_I2C_Expander_12.12)
GPIO_Exp15_Adress2: Ext_GPIO_Bank1 (R701.2 R702.1), Ext_GPIO/Ext_GPIO_Bank1/I2C_Expander_12 (U35_I2C_Expander_12.11)
GPIO_Exp15_Int0: Ext_GPIO/Ext_GPIO_Bank1/I2C_Expander_12 (U35_I2C_Expander_12.16), US_Interrupts (R881.2)
GPIO_Exp15_Int1: Ext_GPIO/Ext_GPIO_Bank1/I2C_Expander_12 (U35_I2C_Expander_12.15), US_Interrupts (R882.2)
GPIO_Exp_Reset0: Ext_GPIO/Ext_GPIO_Bank0/I2C_Expander_00 (U35_I2C_Expander_00.14), Ext_GPIO/Ext_GPIO_Bank0/I2C_Expander_01 (U35_I2C_Expander_01.14), Ext_GPIO/Ext_GPIO_Bank0/I2C_Expander_02 (U35_I2C_Expander_02.14), Expander_RESET (R746.1), U_Expander_RESET/I2C_Expander_Main_Rst (U35_I2C_Expander_Main_Rst.17)
GPIO_Exp_Reset1: Ext_GPIO/Ext_GPIO_Bank1/I2C_Expander_10 (U35_I2C_Expander_10.14), Ext_GPIO/Ext_GPIO_Bank1/I2C_Expander_11 (U35_I2C_Expander_11.14), Ext_GPIO/Ext_GPIO_Bank1/I2C_Expander_12 (U35_I2C_Expander_12.14), Expander_RESET (R747.1), U_Expander_RESET/I2C_Expander_Main_Rst (U35_I2C_Expander_Main_Rst.18)
GPIO_Exp_Reset2: Expander_RESET (R748.1), U_Expander_RESET/I2C_Expander_Main_Rst (U35_I2C_Expander_Main_Rst.19)
GPIO_I2C0.SCL: Ext_GPIO/I2C_Bridge_GPIO (R559_I2C_Bridge_GPIO.2 SP3_I2C_Bridge_GPIO.1 U3_I2C_Bridge_GPIO.2), Ext_GPIO/Ext_GPIO_Bank0/I2C_Expander_00 (U35_I2C_Expander_00.8), Ext_GPIO/Ext_GPIO_Bank0/I2C_Expander_01 (U35_I2C_Expander_01.8), Ext_GPIO/Ext_GPIO_Bank0/I2C_Expander_02 (U35_I2C_Expander_02.8)
GPIO_I2C0.SDA: Ext_GPIO/I2C_Bridge_GPIO (R560_I2C_Bridge_GPIO.2 SP2_I2C_Bridge_GPIO.1 U3_I2C_Bridge_GPIO.1), Ext_GPIO/Ext_GPIO_Bank0/I2C_Expander_00 (U35_I2C_Expander_00.9), Ext_GPIO/Ext_GPIO_Bank0/I2C_Expander_01 (U35_I2C_Expander_01.9), Ext_GPIO/Ext_GPIO_Bank0/I2C_Expander_02 (U35_I2C_Expander_02.9)
GPIO_I2C4.SCL: Ext_GPIO/I2C_Bridge_GPIO (R9_I2C_Bridge_GPIO.2 SP11_I2C_Bridge_GPIO.1 U3_I2C_Bridge_GPIO.11), Ext_GPIO/Ext_GPIO_Bank1/I2C_Expander_10 (U35_I2C_Expander_10.8), Ext_GPIO/Ext_GPIO_Bank1/I2C_Expander_11 (U35_I2C_Expander_11.8), Ext_GPIO/Ext_GPIO_Bank1/I2C_Expander_12 (U35_I2C_Expander_12.8)
GPIO_I2C4.SDA: Ext_GPIO/I2C_Bridge_GPIO (R10_I2C_Bridge_GPIO.2 SP10_I2C_Bridge_GPIO.1 U3_I2C_Bridge_GPIO.10), Ext_GPIO/Ext_GPIO_Bank1/I2C_Expander_10 (U35_I2C_Expander_10.9), Ext_GPIO/Ext_GPIO_Bank1/I2C_Expander_11 (U35_I2C_Expander_11.9), Ext_GPIO/Ext_GPIO_Bank1/I2C_Expander_12 (U35_I2C_Expander_12.9)
GPIOa_00.GPIO5: Power_Ethernet (U51.5), Power_LED (T46.1), GPIO_I2C (R827.2), Ext_GPIO/Ext_GPIO_Bank0/I2C_Expander_00 (U35_I2C_Expander_00.22)
GPIOa_00.GPIO6: Power_Ethernet (U50.5), Power_LED (T42.1), GPIO_I2C (R826.2), Ext_GPIO/Ext_GPIO_Bank0/I2C_Expander_00 (U35_I2C_Expander_00.23)
GPIOa_01.GPIO5: Ext_GPIO/Ext_GPIO_Bank0/I2C_Expander_01 (U35_I2C_Expander_01.22), USB3 (U46.A3)
GPIOa_02.GPIO0: HighSpeed/PCIE0 (J1_PCIE0.18), Ext_GPIO/Ext_GPIO_Bank0/I2C_Expander_02 (U35_I2C_Expander_02.17)
GPIOa_02.GPIO1: Ext_GPIO/Ext_GPIO_Bank0/I2C_Expander_02 (U35_I2C_Expander_02.18), SPI_bridge_Main (R237_SPI_bridge_Main.2)
GPIOa_11.GPIO1: HighSpeed/PCIE1 (J1_PCIE1.18), Ext_GPIO/Ext_GPIO_Bank1/I2C_Expander_11 (U35_I2C_Expander_11.18)
GPIOa_11.GPIO7: WR_Clock (R499.1), Ext_GPIO/Ext_GPIO_Bank1/I2C_Expander_11 (U35_I2C_Expander_11.24)
GPIOb_00.GPIO4: WR_Clock (U16.29), Ext_GPIO/Ext_GPIO_Bank0/I2C_Expander_00 (U35_I2C_Expander_00.1)
GPIOb_00.GPIO5: WR_Clock (U16.28), Ext_GPIO/Ext_GPIO_Bank0/I2C_Expander_00 (U35_I2C_Expander_00.2)
GPIOb_00.GPIO6: WR_Clock (U16.20), Ext_GPIO/Ext_GPIO_Bank0/I2C_Expander_00 (U35_I2C_Expander_00.3)
GPIOb_00.GPIO7: WR_Clock (U16.17), Ext_GPIO/Ext_GPIO_Bank0/I2C_Expander_00 (U35_I2C_Expander_00.4)
GPIOb_01.GPIO2: Ext_GPIO/Ext_GPIO_Bank0/I2C_Expander_01 (U35_I2C_Expander_01.27), SPI_bridge_Main (R235_SPI_bridge_Main.2)
GPIOb_02.GPIO0: HighSpeed/I2C_Bridge_PCIE (SP12_I2C_Bridge_PCIE.1 U3_I2C_Bridge_PCIE.24), Ext_GPIO/Ext_GPIO_Bank0/I2C_Expander_02 (U35_I2C_Expander_02.25)
GPIOb_02.GPIO2: HighSpeed/PCIE3 (J1_PCIE3.18), Ext_GPIO/Ext_GPIO_Bank0/I2C_Expander_02 (U35_I2C_Expander_02.27)
GPIOb_02.GPIO3: HighSpeed/SPI_bridge_PCIe (R237_SPI_bridge_PCIe.2), Ext_GPIO/Ext_GPIO_Bank0/I2C_Expander_02 (U35_I2C_Expander_02.28)
GPIOb_02.GPIO4: ST1L08_5V_0V6 (R691.2 U73.6), Power_LED (T44.1), Ext_GPIO/Ext_GPIO_Bank0/I2C_Expander_02 (U35_I2C_Expander_02.1)
GPIOb_02.GPIO5: HighSpeed/SPI_bridge_PCIe (R232_SPI_bridge_PCIe.1), Ext_GPIO/Ext_GPIO_Bank0/I2C_Expander_02 (U35_I2C_Expander_02.2)
GPIOb_10.GPIO6: HighSpeed/PCIE2 (J1_PCIE2.18), Ext_GPIO/Ext_GPIO_Bank1/I2C_Expander_10 (U35_I2C_Expander_10.3)
GPIOb_11.GPIO1: HighSpeed/PCIE4 (J1_PCIE4.18), Ext_GPIO/Ext_GPIO_Bank1/I2C_Expander_11 (U35_I2C_Expander_11.26)
GPIOb_12.GPIO2: WR_Clock (R540.2), Ext_GPIO/Ext_GPIO_Bank1/I2C_Expander_12 (U35_I2C_Expander_12.27)
GPIOb_12.GPIO7: Power_Low_Curr (U19.23), Power_LED (T3.1), GPIO_I2C (R825.2), Ext_GPIO/Ext_GPIO_Bank1/I2C_Expander_12 (U35_I2C_Expander_12.4)
Ground: WR_Clock (6 pins), Zasilanie_CLKDistribution (52 pins), TPS7A88_5V_Dual_3.3V_3.3V (13 pins)
HiSpeedModule_I2C0.SCL: HighSpeed/I2C_Bridge_PCIE (R225_I2C_Bridge_PCIE.2 SP7_I2C_Bridge_PCIE.1 U3_I2C_Bridge_PCIE.6), Power4HiSpeed (R185.2 R189.2 R213.2 R221.2), HighSpeed/Power4HighSpeed/U_Pomiar_pradu_napiecia_PCIe1 (U64_U_Pomiar_pradu_napiecia_PCIe1.5), HighSpeed/Power4HighSpeed/U_Pomiar_pradu_napiecia_PCIe4 (U64_U_Pomiar_pradu_napiecia_PCIe4.5)
HiSpeedModule_I2C0.SDA: HighSpeed/I2C_Bridge_PCIE (R226_I2C_Bridge_PCIE.2 SP6_I2C_Bridge_PCIE.1 U3_I2C_Bridge_PCIE.5), Power4HiSpeed (R186.2 R190.2 R215.2 R222.2), HighSpeed/Power4HighSpeed/U_Pomiar_pradu_napiecia_PCIe1 (U64_U_Pomiar_pradu_napiecia_PCIe1.4), HighSpeed/Power4HighSpeed/U_Pomiar_pradu_napiecia_PCIe4 (U64_U_Pomiar_pradu_napiecia_PCIe4.4)
HiSpeedModule_I2C1.SCL: HighSpeed/PCIE0 (J1_PCIE0.15), HighSpeed/I2C_Bridge_PCIE (R227_I2C_Bridge_PCIE.2 SP5_I2C_Bridge_PCIE.1 U3_I2C_Bridge_PCIE.4)
HiSpeedModule_I2C1.SDA: HighSpeed/PCIE0 (J1_PCIE0.13), HighSpeed/I2C_Bridge_PCIE (R558_I2C_Bridge_PCIE.2 SP4_I2C_Bridge_PCIE.1 U3_I2C_Bridge_PCIE.3)
HiSpeedModule_I2C2.SCL: HighSpeed/PCIE1 (J1_PCIE1.15), HighSpeed/I2C_Bridge_PCIE (R223_I2C_Bridge_PCIE.2 SP9_I2C_Bridge_PCIE.1 U3_I2C_Bridge_PCIE.8)
HiSpeedModule_I2C2.SDA: HighSpeed/PCIE1 (J1_PCIE1.13), HighSpeed/I2C_Bridge_PCIE (R224_I2C_Bridge_PCIE.2 SP8_I2C_Bridge_PCIE.1 U3_I2C_Bridge_PCIE.7)
HiSpeedModule_I2C3.SCL: HighSpeed/PCIE2 (J1_PCIE2.15), HighSpeed/I2C_Bridge_PCIE (R9_I2C_Bridge_PCIE.2 SP11_I2C_Bridge_PCIE.1 U3_I2C_Bridge_PCIE.11)
HiSpeedModule_I2C3.SDA: HighSpeed/PCIE2 (J1_PCIE2.13), HighSpeed/I2C_Bridge_PCIE (R10_I2C_Bridge_PCIE.2 SP10_I2C_Bridge_PCIE.1 U3_I2C_Bridge_PCIE.10)
HiSpeedModule_I2C4.SCL: HighSpeed/PCIE3 (J1_PCIE3.15), HighSpeed/I2C_Bridge_PCIE (R559_I2C_Bridge_PCIE.2 SP3_I2C_Bridge_PCIE.1 U3_I2C_Bridge_PCIE.2)
HiSpeedModule_I2C4.SDA: HighSpeed/PCIE3 (J1_PCIE3.13), HighSpeed/I2C_Bridge_PCIE (R560_I2C_Bridge_PCIE.2 SP2_I2C_Bridge_PCIE.1 U3_I2C_Bridge_PCIE.1)
HiSpeedModule_I2C5.SCL: HighSpeed/PCIE4 (J1_PCIE4.15), HighSpeed/I2C_Bridge_PCIE (R7_I2C_Bridge_PCIE.2 SP14_I2C_Bridge_PCIE.1 U3_I2C_Bridge_PCIE.13)
HiSpeedModule_I2C5.SDA: HighSpeed/PCIE4 (J1_PCIE4.13), HighSpeed/I2C_Bridge_PCIE (R8_I2C_Bridge_PCIE.2 SP13_I2C_Bridge_PCIE.1 U3_I2C_Bridge_PCIE.12)
HiSpeedModule_I2C6.SCL: HighSpeed/I2C_Bridge_PCIE (R5_I2C_Bridge_PCIE.2 SP16_I2C_Bridge_PCIE.1 U3_I2C_Bridge_PCIE.15), Power4HiSpeed (R176.2 R180.2 R194.2 R198.2), HighSpeed/Power4HighSpeed/U_Pomiar_pradu_napiecia_PCIe0 (U64_U_Pomiar_pradu_napiecia_PCIe0.5), HighSpeed/Power4HighSpeed/U_Pomiar_pradu_napiecia_PCIe2 (U64_U_Pomiar_pradu_napiecia_PCIe2.5)
HiSpeedModule_I2C6.SDA: HighSpeed/I2C_Bridge_PCIE (R6_I2C_Bridge_PCIE.2 SP15_I2C_Bridge_PCIE.1 U3_I2C_Bridge_PCIE.14), Power4HiSpeed (R177.2 R181.2 R195.2 R199.2), HighSpeed/Power4HighSpeed/U_Pomiar_pradu_napiecia_PCIe0 (U64_U_Pomiar_pradu_napiecia_PCIe0.4), HighSpeed/Power4HighSpeed/U_Pomiar_pradu_napiecia_PCIe2 (U64_U_Pomiar_pradu_napiecia_PCIe2.4)
HiSpeedModule_I2C7.SCL: HighSpeed/I2C_Bridge_PCIE (R3_I2C_Bridge_PCIE.2 SP18_I2C_Bridge_PCIE.1 U3_I2C_Bridge_PCIE.17), Power4HiSpeed (R203.2 R207.2), HighSpeed/Power4HighSpeed/U_Pomiar_pradu_napiecia_PCIe3 (U64_U_Pomiar_pradu_napiecia_PCIe3.5)
HiSpeedModule_I2C7.SDA: HighSpeed/I2C_Bridge_PCIE (R4_I2C_Bridge_PCIE.2 SP17_I2C_Bridge_PCIE.1 U3_I2C_Bridge_PCIE.16), Power4HiSpeed (R204.2 R208.2), HighSpeed/Power4HighSpeed/U_Pomiar_pradu_napiecia_PCIe3 (U64_U_Pomiar_pradu_napiecia_PCIe3.4)
HiSpeedModule_SPI0.~{CS}: HighSpeed/PCIE0 (J1_PCIE0.51), HighSpeed/SPI_bridge_PCIe (R231_SPI_bridge_PCIe.1 SP21_SPI_bridge_PCIe.1 U24_SPI_bridge_PCIe.11)
HiSpeedModule_SPI0.CLK: HighSpeed/PCIE0 (J1_PCIE0.45), HighSpeed/SPI_bridge_PCIe (U24_SPI_bridge_PCIe.14)
HiSpeedModule_SPI0.MISO: HighSpeed/PCIE0 (J1_PCIE0.49), HighSpeed/SPI_bridge_PCIe (U24_SPI_bridge_PCIe.13)
HiSpeedModule_SPI0.MOSI: HighSpeed/PCIE0 (J1_PCIE0.47), HighSpeed/SPI_bridge_PCIe (U24_SPI_bridge_PCIe.12)
HiSpeedModule_SPI1.~{CS}: HighSpeed/PCIE1 (J1_PCIE1.51), HighSpeed/SPI_bridge_PCIe (R233_SPI_bridge_PCIe.1 SP23_SPI_bridge_PCIe.1 U25_SPI_bridge_PCIe.11)
HiSpeedModule_SPI1.CLK: HighSpeed/PCIE1 (J1_PCIE1.45), HighSpeed/SPI_bridge_PCIe (U25_SPI_bridge_PCIe.14)
HiSpeedModule_SPI1.MISO: HighSpeed/PCIE1 (J1_PCIE1.49), HighSpeed/SPI_bridge_PCIe (U25_SPI_bridge_PCIe.13)
HiSpeedModule_SPI1.MOSI: HighSpeed/PCIE1 (J1_PCIE1.47), HighSpeed/SPI_bridge_PCIe (U25_SPI_bridge_PCIe.12)
HiSpeedModule_SPI2.~{CS}: HighSpeed/PCIE2 (J1_PCIE2.51), HighSpeed/SPI_bridge_PCIe (R236_SPI_bridge_PCIe.1 SP25_SPI_bridge_PCIe.1 U26_SPI_bridge_PCIe.11)
HiSpeedModule_SPI2.CLK: HighSpeed/PCIE2 (J1_PCIE2.45), HighSpeed/SPI_bridge_PCIe (U26_SPI_bridge_PCIe.14)
HiSpeedModule_SPI2.MISO: HighSpeed/PCIE2 (J1_PCIE2.49), HighSpeed/SPI_bridge_PCIe (U26_SPI_bridge_PCIe.13)
HiSpeedModule_SPI2.MOSI: HighSpeed/PCIE2 (J1_PCIE2.47), HighSpeed/SPI_bridge_PCIe (U26_SPI_bridge_PCIe.12)
HiSpeedModule_SPI3.~{CS}: HighSpeed/PCIE3 (J1_PCIE3.51), HighSpeed/SPI_bridge_PCIe (R238_SPI_bridge_PCIe.1 SP27_SPI_bridge_PCIe.1 U27_SPI_bridge_PCIe.11)
HiSpeedModule_SPI3.CLK: HighSpeed/PCIE3 (J1_PCIE3.45), HighSpeed/SPI_bridge_PCIe (U27_SPI_bridge_PCIe.14)
HiSpeedModule_SPI3.MISO: HighSpeed/PCIE3 (J1_PCIE3.49), HighSpeed/SPI_bridge_PCIe (U27_SPI_bridge_PCIe.13)
HiSpeedModule_SPI3.MOSI: HighSpeed/PCIE3 (J1_PCIE3.47), HighSpeed/SPI_bridge_PCIe (U27_SPI_bridge_PCIe.12)
HiSpeedModule_SPI4.~{CS}: HighSpeed/PCIE4 (J1_PCIE4.51), HighSpeed/SPI_bridge_PCIe (R240_SPI_bridge_PCIe.1 SP29_SPI_bridge_PCIe.1 U28_SPI_bridge_PCIe.11)
HiSpeedModule_SPI4.CLK: HighSpeed/PCIE4 (J1_PCIE4.45), HighSpeed/SPI_bridge_PCIe (U28_SPI_bridge_PCIe.14)
HiSpeedModule_SPI4.MISO: HighSpeed/PCIE4 (J1_PCIE4.49), HighSpeed/SPI_bridge_PCIe (U28_SPI_bridge_PCIe.13)
HiSpeedModule_SPI4.MOSI: HighSpeed/PCIE4 (J1_PCIE4.47), HighSpeed/SPI_bridge_PCIe (U28_SPI_bridge_PCIe.12)
I2C0_PS.SCL: Ultrascale+_01 (J12.1 R85.1 R774.1), Trans_PS_I2C0 (SP34_Trans_PS_I2C0.1 U36_Trans_PS_I2C0.3)
I2C0_PS.SDA: Ultrascale+_01 (J12.2 R86.1 R775.1), Trans_PS_I2C0 (SP35_Trans_PS_I2C0.1 U36_Trans_PS_I2C0.4)
I2C0_Rail.SCL: Trans_LS_I2C0 (U36_Trans_LS_I2C0.6), SFP_Group+IMU/I2C_Bridge_SFP (U3_I2C_Bridge_SFP.19), Trans_PS_I2C0 (U36_Trans_PS_I2C0.6)
I2C0_Rail.SDA: Trans_LS_I2C0 (U36_Trans_LS_I2C0.5), SFP_Group+IMU/I2C_Bridge_SFP (U3_I2C_Bridge_SFP.20), Trans_PS_I2C0 (U36_Trans_PS_I2C0.5)
I2C1_PS.SCL: Ultrascale+_01 (J13.1 R83.1 R772.1), Trans_PS_I2C1 (SP34_Trans_PS_I2C1.1 U36_Trans_PS_I2C1.3)
I2C1_PS.SDA: Ultrascale+_01 (J13.2 R84.1 R773.1), Trans_PS_I2C1 (SP35_Trans_PS_I2C1.1 U36_Trans_PS_I2C1.4)
I2C1_Rail.SCL: GPIO_I2C (R599.1), Ext_GPIO/I2C_Bridge_GPIO (U3_I2C_Bridge_GPIO.19), Trans_PS_I2C1 (U36_Trans_PS_I2C1.6), Trans_LS_I2C1 (U36_Trans_LS_I2C1.6), U_Expander_RESET/I2C_Expander_Main_Rst (U35_I2C_Expander_Main_Rst.8)
I2C1_Rail.SDA: GPIO_I2C (R428.1), Ext_GPIO/I2C_Bridge_GPIO (U3_I2C_Bridge_GPIO.20), Trans_PS_I2C1 (U36_Trans_PS_I2C1.5), Trans_LS_I2C1 (U36_Trans_LS_I2C1.5), U_Expander_RESET/I2C_Expander_Main_Rst (U35_I2C_Expander_Main_Rst.9)
I2C_LS.SCL: Ultrascale+_02 (R363.2 U1.AG1), Trans_LS_I2C0 (SP34_Trans_LS_I2C0.1 U36_Trans_LS_I2C0.3), Trans_LS_I2C1 (SP34_Trans_LS_I2C1.1 U36_Trans_LS_I2C1.3)
I2C_LS.SDA: Ultrascale+_02 (R364.2 U1.AF3), Trans_LS_I2C0 (SP35_Trans_LS_I2C0.1 U36_Trans_LS_I2C0.4), Trans_LS_I2C1 (SP35_Trans_LS_I2C1.1 U36_Trans_LS_I2C1.4)
I2C_SCL_SFP0: SFP (J32.5), SFP_Group+IMU/I2C_Bridge_SFP (R225_I2C_Bridge_SFP.2 SP7_I2C_Bridge_SFP.1 U3_I2C_Bridge_SFP.6)
I2C_SCL_SFP1: SFP1 (J33.5), SFP_Group+IMU/I2C_Bridge_SFP (R559_I2C_Bridge_SFP.2 SP3_I2C_Bridge_SFP.1 U3_I2C_Bridge_SFP.2)
I2C_SCL_SFP2: SFP2 (J34.5), SFP_Group+IMU/I2C_Bridge_SFP (R223_I2C_Bridge_SFP.2 SP9_I2C_Bridge_SFP.1 U3_I2C_Bridge_SFP.8)
I2C_SCL_SFP3: SFP3 (J35.5), SFP_Group+IMU/I2C_Bridge_SFP (R227_I2C_Bridge_SFP.2 SP5_I2C_Bridge_SFP.1 U3_I2C_Bridge_SFP.4)
I2C_SDA_SFP0: SFP (J32.4), SFP_Group+IMU/I2C_Bridge_SFP (R226_I2C_Bridge_SFP.2 SP6_I2C_Bridge_SFP.1 U3_I2C_Bridge_SFP.5)
I2C_SDA_SFP1: SFP1 (J33.4), SFP_Group+IMU/I2C_Bridge_SFP (R560_I2C_Bridge_SFP.2 SP2_I2C_Bridge_SFP.1 U3_I2C_Bridge_SFP.1)
I2C_SDA_SFP2: SFP2 (J34.4), SFP_Group+IMU/I2C_Bridge_SFP (R224_I2C_Bridge_SFP.2 SP8_I2C_Bridge_SFP.1 U3_I2C_Bridge_SFP.7)
I2C_SDA_SFP3: SFP3 (J35.4), SFP_Group+IMU/I2C_Bridge_SFP (R558_I2C_Bridge_SFP.2 SP4_I2C_Bridge_SFP.1 U3_I2C_Bridge_SFP.3)
IMU_INT1: IMU (U58.4), US_Interrupts (R822.2)
IMU_INT2: IMU (U58.9), US_Interrupts (R851.2)
INTA_EXP_MAIN: U_Expander_RESET/I2C_Expander_Main_Rst (U35_I2C_Expander_Main_Rst.16), US_Interrupts (R972.2)
INTB_EXP_MAIN: U_Expander_RESET/I2C_Expander_Main_Rst (U35_I2C_Expander_Main_Rst.15), US_Interrupts (R973.2)
JTAG_CLK: RJ45 (U39.20), FTDI (R1042.1)
JTAG_TDI: RJ45 (R336.2 U39.23), FTDI (R1040.1)
JTAG_TDO: RJ45 (R337.2 U39.21), FTDI (R1043.1)
JTAG_TMS: RJ45 (R338.2 U39.22), FTDI (R1041.1)
LTC6952_0_MATCH_Out0_N: LTC6952 (C315.1 R1054.1), HighSpeed/PCIE0 (J1_PCIE0.7)
LTC6952_0_MATCH_Out0_P: LTC6952 (C315.2 R539.1), HighSpeed/PCIE0 (J1_PCIE0.5)
LTC6952_0_MATCH_Out1_N: LTC6952 (C317.1 R1056.1), HighSpeed/PCIE3 (J1_PCIE3.7)
LTC6952_0_MATCH_Out1_P: LTC6952 (C317.2 R1055.1), HighSpeed/PCIE3 (J1_PCIE3.5)
LTC6952_0_MATCH_Out3_N: LTC6952_1 (R535.1 U13.48), LTC6952 (R1074.1)
LTC6952_0_MATCH_Out3_P: LTC6952_1 (R535.2 U13.47), LTC6952 (R1073.1)
LTC6952_0_MATCH_Out4_N: LTC6952_1 (R534.2 U13.37), LTC6952 (R1072.2)
LTC6952_0_MATCH_Out4_P: LTC6952_1 (R534.1 U13.38), LTC6952 (R1071.2)
LTC6952_0_MATCH_Out6_N: LTC6952 (C602.2 R1068.1), Sata (J27.53)
LTC6952_0_MATCH_Out6_P: LTC6952 (C602.1 R1067.1), Sata (J27.55)
LTC6952_0_MATCH_Out7_N: LTC6952 (C608.1 U12.12), GTR (C526.2)
LTC6952_0_MATCH_Out7_P: LTC6952 (C608.2 U12.13), GTR (C525.2)
LTC6952_0_MATCH_Out8_N: LTC6952 (C682.1 U12.9), GTR (C528.2)
LTC6952_0_MATCH_Out8_P: LTC6952 (C682.2 U12.10), GTR (C527.2)
LTC6952_0_MATCH_Out9_N: LTC6952 (C684.1 U12.6), GTR (C530.2)
LTC6952_0_MATCH_Out9_P: LTC6952 (C684.2 U12.7), GTR (C529.2)
LTC6952_1_CP_Out: System_CLK (C46.2 R77.2 TP19.1 X1.2), LTC6952 (U12.43)
LTC6952_1_MATCH_Out0_N: LTC6952_1 (C41.2 C119#1.2), bank226 (U1.D9)
LTC6952_1_MATCH_Out0_P: LTC6952_1 (C41.1 C118#1.2), bank226 (U1.D10)
LTC6952_1_MATCH_Out1_N: LTC6952_1 (C799.2 R1092.1), Ultrascale+_02 (U1.AH2)
LTC6952_1_MATCH_Out1_P: LTC6952_1 (C799.1 R1091.1), Ultrascale+_02 (U1.AH3)
LTC6952_1_MATCH_Out2_N: LTC6952_1 (C802.2 R1094.1), HighSpeed/PCIE2 (J1_PCIE2.7)
LTC6952_1_MATCH_Out2_P: LTC6952_1 (C802.1 R1093.1), HighSpeed/PCIE2 (J1_PCIE2.5)
LTC6952_1_MATCH_Out7_N: LTC6952_1 (C814.2 R1106.1), HighSpeed/PCIE1 (J1_PCIE1.7)
LTC6952_1_MATCH_Out7_P: LTC6952_1 (C814.1 R1105.1), HighSpeed/PCIE1 (J1_PCIE1.5)
LTC6952_1_MATCH_Out8_N: WR_Clock (C690.2 R1084.1), LTC6952_1 (U13.9)
LTC6952_1_MATCH_Out8_P: WR_Clock (C690.1 R1083.1), LTC6952_1 (U13.10)
LTC6952_1_MATCH_Out9_N: LTC6952_1 (C818.2 R1110.1), HighSpeed/PCIE4 (J1_PCIE4.7)
LTC6952_1_MATCH_Out9_P: LTC6952_1 (C818.1 R1109.1), HighSpeed/PCIE4 (J1_PCIE4.5)
LTC6952_1_Temp: LTC6952 (U12.49), Ultrascale+_02 (R395.2)
LTC6952_1_VCO_N: System_CLK (C334.1 R532.2), LTC6952 (R80.2 U12.37)
LTC6952_1_VCO_P: System_CLK (R533.2), LTC6952 (R80.1 U12.38)
LTC6952_2_Temp: LTC6952_1 (U13.49), Ultrascale+_02 (R398.2)
MainExpReset: Expander_RESET (R1002.1 T1.3), U_Expander_RESET/I2C_Expander_Main_Rst (U35_I2C_Expander_Main_Rst.14)
MIO_GPIO_0_12: Ultrascale+_01 (J15.2 R780.1), LED_US_1 (R1095.2)
MIO_GPIO_0_23: Ultrascale+_01 (J16.2 R98.1 R781.1), LED_US_1 (R1099.2)
MIO_GPIO_1_38: Ultrascale+_01 (J17.2 R796.1 TP36.1), LED_US_1 (R1107.2)
MIO_GPIO_2_66: Ultrascale+_01 (J19.2 R805.1), LED_US_1 (R1111.2)
MIO_GPIO_2_70: Ultrascale+_01 (J20.2 R809.1), LED_US_1 (R1113.2)
MIO_GPIO_2_73: Ultrascale+_01 (J22.2 R812.1), LED_US_1 (R1117.2)
MIO_GPIO_2_74: Ultrascale+_01 (J23.2 R813.1), LED_US_1 (R1119.2), Trans_PS_I2C1 (U36_Trans_PS_I2C1.8)
MIO_GPIO_2_75: Ultrascale+_01 (J24.2 R814.1), LED_US_1 (R1121.2), Trans_PS_I2C0 (U36_Trans_PS_I2C0.8)
NetC713_2: System_CLK (X1.14), UM78M_12_8V (C713.2 U71.3)
NetJ1_PCIE0_20: Ultrascale+_02 (R507.2), HighSpeed/PCIE0 (J1_PCIE0.20)
NetJ1_PCIE0_43: HighSpeed/PCIE0 (J1_PCIE0.43), US_Interrupts (R967.2)
NetJ1_PCIE1_20: Ultrascale+_02 (R514.2), HighSpeed/PCIE1 (J1_PCIE1.20)
NetJ1_PCIE1_43: HighSpeed/PCIE1 (J1_PCIE1.43), US_Interrupts (R968.2)
NetJ1_PCIE2_20: Ultrascale+_02 (R901.2), HighSpeed/PCIE2 (J1_PCIE2.20)
NetJ1_PCIE2_43: HighSpeed/PCIE2 (J1_PCIE2.43), US_Interrupts (R969.2)
NetJ1_PCIE3_20: Ultrascale+_02 (R902.2), HighSpeed/PCIE3 (J1_PCIE3.20)
NetJ1_PCIE3_43: HighSpeed/PCIE3 (J1_PCIE3.43), US_Interrupts (R970.2)
NetJ1_PCIE4_20: Ultrascale+_02 (R903.2), HighSpeed/PCIE4 (J1_PCIE4.20)
NetJ1_PCIE4_43: HighSpeed/PCIE4 (J1_PCIE4.43), US_Interrupts (R971.2)
NetR14_1: Power_Hi_Curr (R14.1 R16.1 R22.1 R24.1), Pomiar_napiecia_high_curr (U72.2)
NetR132_1: WR_Clock (R132.1), SPI_bridge_Main (U28_SPI_bridge_Main.14)
NetR133_1: WR_Clock (R133.1), SPI_bridge_Main (U28_SPI_bridge_Main.13)
NetR134_1: WR_Clock (R134.1), SPI_bridge_Main (U28_SPI_bridge_Main.12)
NetR174_1: Power4HiSpeed (R174.1 R175.1 R176.1 R177.1), HighSpeed/Power4HighSpeed/U_Pomiar_pradu_napiecia_PCIe0 (U64_U_Pomiar_pradu_napiecia_PCIe0.2)
NetR178_1: Power4HiSpeed (R178.1 R179.1 R180.1 R181.1), HighSpeed/Power4HighSpeed/U_Pomiar_pradu_napiecia_PCIe0 (U64_U_Pomiar_pradu_napiecia_PCIe0.1)
NetR183_1: Power4HiSpeed (R183.1 R184.1 R185.1 R186.1), HighSpeed/Power4HighSpeed/U_Pomiar_pradu_napiecia_PCIe1 (U64_U_Pomiar_pradu_napiecia_PCIe1.2)
NetR187_1: Power4HiSpeed (R187.1 R188.1 R189.1 R190.1), HighSpeed/Power4HighSpeed/U_Pomiar_pradu_napiecia_PCIe1 (U64_U_Pomiar_pradu_napiecia_PCIe1.1)
NetR192_1: Power4HiSpeed (R192.1 R193.1 R194.1 R195.1), HighSpeed/Power4HighSpeed/U_Pomiar_pradu_napiecia_PCIe2 (U64_U_Pomiar_pradu_napiecia_PCIe2.2)
NetR196_1: Power4HiSpeed (R196.1 R197.1 R198.1 R199.1), HighSpeed/Power4HighSpeed/U_Pomiar_pradu_napiecia_PCIe2 (U64_U_Pomiar_pradu_napiecia_PCIe2.1)
NetR201_1: Power4HiSpeed (R201.1 R202.1 R203.1 R204.1), HighSpeed/Power4HighSpeed/U_Pomiar_pradu_napiecia_PCIe3 (U64_U_Pomiar_pradu_napiecia_PCIe3.2)
NetR205_1: Power4HiSpeed (R205.1 R206.1 R207.1 R208.1), HighSpeed/Power4HighSpeed/U_Pomiar_pradu_napiecia_PCIe3 (U64_U_Pomiar_pradu_napiecia_PCIe3.1)
NetR210_1: Power4HiSpeed (R210.1 R211.1 R213.1 R215.1), HighSpeed/Power4HighSpeed/U_Pomiar_pradu_napiecia_PCIe4 (U64_U_Pomiar_pradu_napiecia_PCIe4.2)
NetR217_1: Power4HiSpeed (R217.1 R219.1 R221.1 R222.1), HighSpeed/Power4HighSpeed/U_Pomiar_pradu_napiecia_PCIe4 (U64_U_Pomiar_pradu_napiecia_PCIe4.1)
NetR229_1: Power_Distribution (R229.1 R230.1 R457.1 R459.1), PowerDistribition/U_Pomiar_pradu_napiecia_1 (U64_U_Pomiar_pradu_napiecia_1.2)
NetR231_SPI_bridge_Main_1: HighSpeed/SPI_bridge_PCIe (5 pins), SPI_bridge_Main (R231_SPI_bridge_Main.1 SP21_SPI_bridge_Main.1 U24_SPI_bridge_Main.11)
NetR240_SPI_bridge_Main_1: WR_Clock (R912.1), SPI_bridge_Main (R240_SPI_bridge_Main.1 SP29_SPI_bridge_Main.1 U28_SPI_bridge_Main.11)
NetR241_2: GPIO_I2C (R241.2 R242.1), Ext_GPIO/I2C_Bridge_GPIO (U3_I2C_Bridge_GPIO.22)
NetR243_2: GPIO_I2C (R243.2 R244.1), Ext_GPIO/I2C_Bridge_GPIO (U3_I2C_Bridge_GPIO.23)
NetR281_2: GPIO_I2C (R281.2 R400.1), Ext_GPIO/I2C_Bridge_GPIO (U3_I2C_Bridge_GPIO.18)
NetR304_1: Power_Hi_Curr (R304.1 R388.1 R389.1 R390.1), Pomiar_napiecia_high_curr (U72.1)
NetR449_2: JESD204_B_or_C (R449.2 R450.1), HighSpeed/I2C_Bridge_PCIE (U3_I2C_Bridge_PCIE.22)
NetR451_2: JESD204_B_or_C (R451.2 R452.1), HighSpeed/I2C_Bridge_PCIE (U3_I2C_Bridge_PCIE.23)
NetR453_2: JESD204_B_or_C (R453.2 R454.1), HighSpeed/I2C_Bridge_PCIE (U3_I2C_Bridge_PCIE.18)
NetR455_2: Power_Distribution (R455.2 R456.1), PowerDistribition/I2C_Expander_PWR_Dist (U35_I2C_Expander_PWR_Dist.13)
NetR458_2: Power_Distribution (R458.2 R460.1), PowerDistribition/I2C_Expander_PWR_Dist (U35_I2C_Expander_PWR_Dist.12)
NetR461_1: Power_Distribution (R461.1 R463.1 R465.1 R466.1), PowerDistribition/U_Pomiar_pradu_napiecia_1 (U64_U_Pomiar_pradu_napiecia_1.1)
NetR462_2: Power_Distribution (R462.2 R464.1), PowerDistribition/I2C_Expander_PWR_Dist (U35_I2C_Expander_PWR_Dist.11)
NetR467_1: Power_Distribution (R467.1 R468.1 R593.1 R594.1), PowerDistribition/U_Pomiar_pradu_napiecia_2 (U64_U_Pomiar_pradu_napiecia_2.2)
NetR469_2: SFP_Group (R469.2 R470.1), SFP_Group+IMU/I2C_Bridge_SFP (U3_I2C_Bridge_SFP.22)
NetR471_2: SFP_Group (R471.2 R472.1), SFP_Group+IMU/I2C_Bridge_SFP (U3_I2C_Bridge_SFP.23)
NetR473_2: SFP_Group (R473.2 R474.1), SFP_Group+IMU/I2C_Bridge_SFP (U3_I2C_Bridge_SFP.18)
NetR475_2: SFP_Group (R475.2 R476.1), SFP_Group+IMU/I2C_Expander_SFP (U35_I2C_Expander_SFP.13)
NetR477_2: SFP_Group (R477.2 R478.1), SFP_Group+IMU/I2C_Expander_SFP (U35_I2C_Expander_SFP.12)
NetR479_2: SFP_Group (R479.2 R480.1), SFP_Group+IMU/I2C_Expander_SFP (U35_I2C_Expander_SFP.11)
NetR481_2: DAC (R481.2), SPI_bridge_Main (U27_SPI_bridge_Main.13)
NetR561_1: Power_Hi_Curr (R561.1 R562.1 R563.1 R564.1), PowerDistribition/HiCurrent/U_Pomiar_pradu_napiecia_3 (U64_U_Pomiar_pradu_napiecia_3.2)
NetR565_1: Power_Hi_Curr (R565.1 R566.1 R567.1 R568.1), PowerDistribition/HiCurrent/U_Pomiar_pradu_napiecia_3 (U64_U_Pomiar_pradu_napiecia_3.1)
NetR569_1: Power_Hi_Curr (R569.1 R570.1 R571.1 R572.1), PowerDistribition/HiCurrent/U_Pomiar_pradu_napiecia_4 (U64_U_Pomiar_pradu_napiecia_4.2)
NetR573_1: Power_Hi_Curr (R573.1 R574.1 R575.1 R576.1), PowerDistribition/HiCurrent/U_Pomiar_pradu_napiecia_4 (U64_U_Pomiar_pradu_napiecia_4.1)
NetR577_1: Power_Hi_Curr (R577.1 R578.1 R579.1 R580.1), PowerDistribition/HiCurrent/U_Pomiar_pradu_napiecia_5 (U64_U_Pomiar_pradu_napiecia_5.2)
NetR581_1: Power_Hi_Curr (R581.1 R582.1 R583.1 R584.1), PowerDistribition/HiCurrent/U_Pomiar_pradu_napiecia_5 (U64_U_Pomiar_pradu_napiecia_5.1)
NetR585_1: Power_Hi_Curr (R585.1 R586.1 R587.1 R588.1), PowerDistribition/HiCurrent/U_Pomiar_pradu_napiecia_6 (U64_U_Pomiar_pradu_napiecia_6.2)
NetR589_1: Power_Hi_Curr (R589.1 R590.1 R591.1 R592.1), PowerDistribition/HiCurrent/U_Pomiar_pradu_napiecia_6 (U64_U_Pomiar_pradu_napiecia_6.1)
NetR595_1: Power_Distribution (R595.1 R596.1 R597.1 R598.1), PowerDistribition/U_Pomiar_pradu_napiecia_2 (U64_U_Pomiar_pradu_napiecia_2.1)
NetR738_2: Zasilanie_CLKDistribution (R738.2 R739.2), PowerDistribition/Zasilanie CLK/I2C_Expander_PWR_CLK (U35_I2C_Expander_PWR_CLK.13)
NetR740_2: Zasilanie_CLKDistribution (R740.2 R741.2), PowerDistribition/Zasilanie CLK/I2C_Expander_PWR_CLK (U35_I2C_Expander_PWR_CLK.12)
NetR742_2: Zasilanie_CLKDistribution (R742.2 R743.2), PowerDistribition/Zasilanie CLK/I2C_Expander_PWR_CLK (U35_I2C_Expander_PWR_CLK.11)
NetR749_1: Expander_RESET (R749.1), U_Expander_RESET/I2C_Expander_Main_Rst (U35_I2C_Expander_Main_Rst.20)
NetR750_1: Expander_RESET (R750.1), U_Expander_RESET/I2C_Expander_Main_Rst (U35_I2C_Expander_Main_Rst.21)
NetR751_1: Expander_RESET (R751.1), U_Expander_RESET/I2C_Expander_Main_Rst (U35_I2C_Expander_Main_Rst.22)
NetR752_1: Expander_RESET (R752.1), U_Expander_RESET/I2C_Expander_Main_Rst (U35_I2C_Expander_Main_Rst.23)
NetR753_1: Expander_RESET (R753.1), U_Expander_RESET/I2C_Expander_Main_Rst (U35_I2C_Expander_Main_Rst.25)
NetR754_1: PowerDistribition/Zasilanie CLK/I2C_Expander_PWR_CLK (U35_I2C_Expander_PWR_CLK.14), Expander_RESET (R754.1), U_Expander_RESET/I2C_Expander_Main_Rst (U35_I2C_Expander_Main_Rst.26)
NetR758_2: Expander_RESET (R758.2 R759.1), U_Expander_RESET/I2C_Expander_Main_Rst (U35_I2C_Expander_Main_Rst.13)